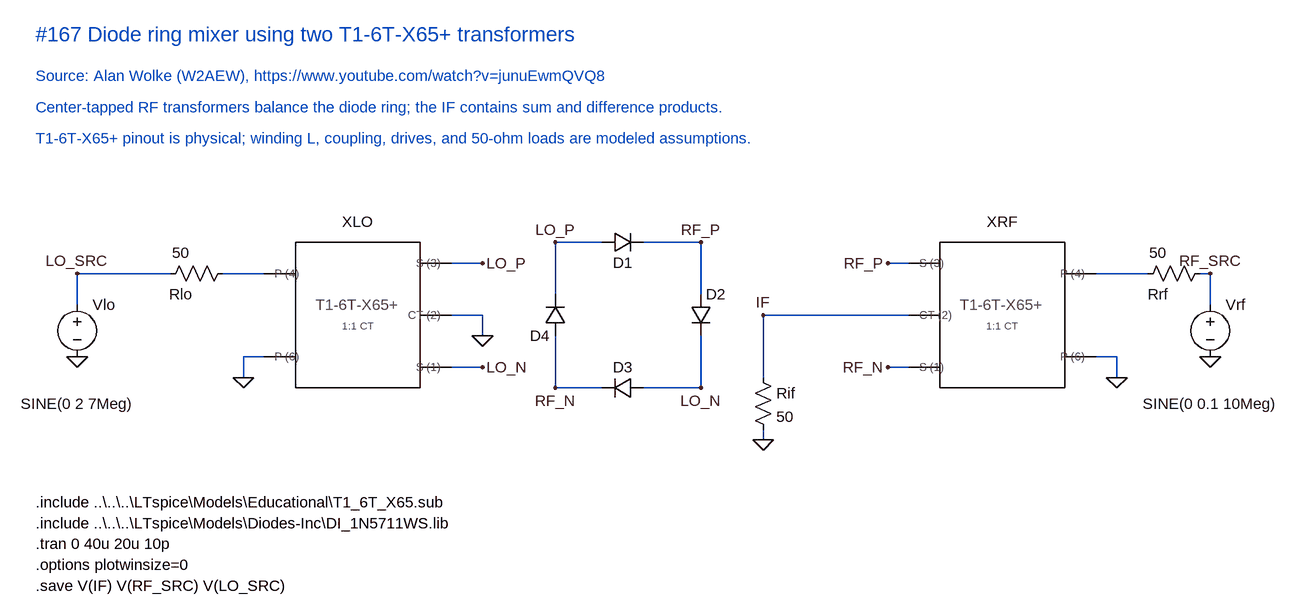
[diagram p0: schematic Diode ring mixer - T1-6T-X65+.asc]
Diode ring mixer - T1-6T-X65+.asc, the LTspice schematic file:
Version 4.1
SHEET 1 2200 1000
WIRE 120 16 48 16
WIRE 272 16 184 16
WIRE -64 48 -112 48
WIRE 592 48 560 48
WIRE -544 64 -688 64
WIRE -400 64 -464 64
WIRE 960 64 880 64
WIRE 1056 64 1040 64
WIRE 48 96 48 16
WIRE 272 96 272 16
WIRE -688 112 -688 64
WIRE 1056 112 1056 64
WIRE -64 128 -112 128
WIRE 592 128 368 128
WIRE -64 160 -64 128
WIRE -400 192 -432 192
WIRE 912 192 880 192
WIRE -64 208 -112 208
WIRE 592 208 560 208
WIRE -432 224 -432 192
WIRE 368 224 368 128
WIRE 912 224 912 192
WIRE 48 240 48 160
WIRE 120 240 48 240
WIRE 272 240 272 160
WIRE 272 240 184 240
WIRE 368 320 368 304
FLAG -688 192 0
FLAG -432 224 0
FLAG -688 64 LO_SRC
FLAG -64 160 0
FLAG -64 48 LO_P
FLAG -64 208 LO_N
FLAG 48 16 LO_P
FLAG 272 16 RF_P
FLAG 272 240 LO_N
FLAG 48 240 RF_N
FLAG 560 48 RF_P
FLAG 560 208 RF_N
FLAG 368 128 IF
FLAG 368 320 0
FLAG 1056 192 0
FLAG 912 224 0
FLAG 1056 64 RF_SRC
SYMBOL ..\..\..\LTspice\Symbols\T1_6T_X65_LO -256 128 R0
SYMATTR InstName XLO
SYMBOL ..\..\..\LTspice\Symbols\T1_6T_X65_RF 736 128 R0
SYMATTR InstName XRF
SYMBOL diode 120 32 R270
WINDOW 0 0 32 VBottom 2
WINDOW 3 32 32 Invisible 2
SYMATTR InstName D1
SYMATTR Value DI_1N5711WS
SYMBOL diode 256 96 R0
WINDOW 3 32 32 Invisible 2
SYMATTR Value DI_1N5711WS
SYMATTR InstName D2
SYMBOL diode 184 224 R90
WINDOW 0 0 32 VBottom 2
WINDOW 3 32 32 Invisible 2
SYMATTR InstName D3
SYMATTR Value DI_1N5711WS
SYMBOL diode 64 160 R180
WINDOW 3 32 32 Invisible 2
SYMATTR Value DI_1N5711WS
SYMATTR InstName D4
SYMBOL res 352 208 R0
SYMATTR InstName Rif
SYMATTR Value 50
SYMBOL res -560 80 R270
WINDOW 0 0 32 VBottom 2
WINDOW 3 32 32 VTop 2
SYMATTR InstName Rlo
SYMATTR Value 50
SYMBOL res 944 80 R270
WINDOW 0 0 32 VBottom 2
WINDOW 3 32 32 VTop 2
SYMATTR InstName Rrf
SYMATTR Value 50
SYMBOL voltage -688 96 R0
WINDOW 3 0 168 Center 2
SYMATTR Value SINE(0 2 7Meg)
SYMATTR InstName Vlo
SYMBOL voltage 1056 96 R0
WINDOW 3 0 168 Center 2
SYMATTR Value SINE(0 0.1 10Meg)
SYMATTR InstName Vrf
TEXT -752 -304 Left 3 ;#167 Diode ring mixer using two T1-6T-X65+ transformers
TEXT -752 -240 Left 2 ;Source: Alan Wolke (W2AEW), https://www.youtube.com/watch?v=junuEwmQVQ8
TEXT -752 -192 Left 2 ;Center-tapped RF transformers balance the diode ring; the IF contains sum and difference products.
TEXT -752 -144 Left 2 ;T1-6T-X65+ pinout is physical; winding L, coupling, drives, and 50-ohm loads are modeled assumptions.
TEXT -752 416 Left 2 !.include ..\..\..\LTspice\Models\Educational\T1_6T_X65.sub
TEXT -752 448 Left 2 !.include ..\\..\\..\\LTspice\\Models\\Diodes-Inc\\DI_1N5711WS.lib
TEXT -752 480 Left 2 !.tran 0 40u 20u 10p
TEXT -752 512 Left 2 !.options plotwinsize=0
TEXT -752 544 Left 2 !.save V(IF) V(RF_SRC) V(LO_SRC)

The netlist it stands for:
* Diode ring mixer - T1-6T-X65+.asc
X§XLO N001 0 LO_P 0 LO_N T1_6T_X65  ; pins P_(4) P_(6) S_(3) CT_(2) S_(1)
X§XRF N002 0 RF_P IF RF_N T1_6T_X65  ; pins P_(4) P_(6) S_(3) CT_(2) S_(1)
D1 LO_P RF_P DI_1N5711WS
D2 RF_P LO_N DI_1N5711WS
D3 LO_N RF_N DI_1N5711WS
D4 RF_N LO_P DI_1N5711WS
Rif IF 0 50
Rlo LO_SRC N001 50
Rrf N002 RF_SRC 50
Vlo LO_SRC 0 SINE(0 2 7Meg)
Vrf RF_SRC 0 SINE(0 0.1 10Meg)
.model D D
.lib standard.dio
* #167 Diode ring mixer using two T1-6T-X65+ transformers
* Source: Alan Wolke (W2AEW), https://www.youtube.com/watch?v=junuEwmQVQ8
* Center-tapped RF transformers balance the diode ring; the IF contains sum and difference products.
* T1-6T-X65+ pinout is physical; winding L, coupling, drives, and 50-ohm loads are modeled assumptions.
.include ..\..\..\LTspice\Models\Educational\T1_6T_X65.sub
.include ..\..\..\LTspice\Models\Diodes-Inc\DI_1N5711WS.lib
.tran 0 40u 20u 10p
.options plotwinsize=0
.save V(IF) V(RF_SRC) V(LO_SRC)
.backanno
.end